# Altium schematic sheet [03] - ADSP.SchDoc
size A2; DocumentNumber: 2; SheetNumber: 3; SheetTotal: 10
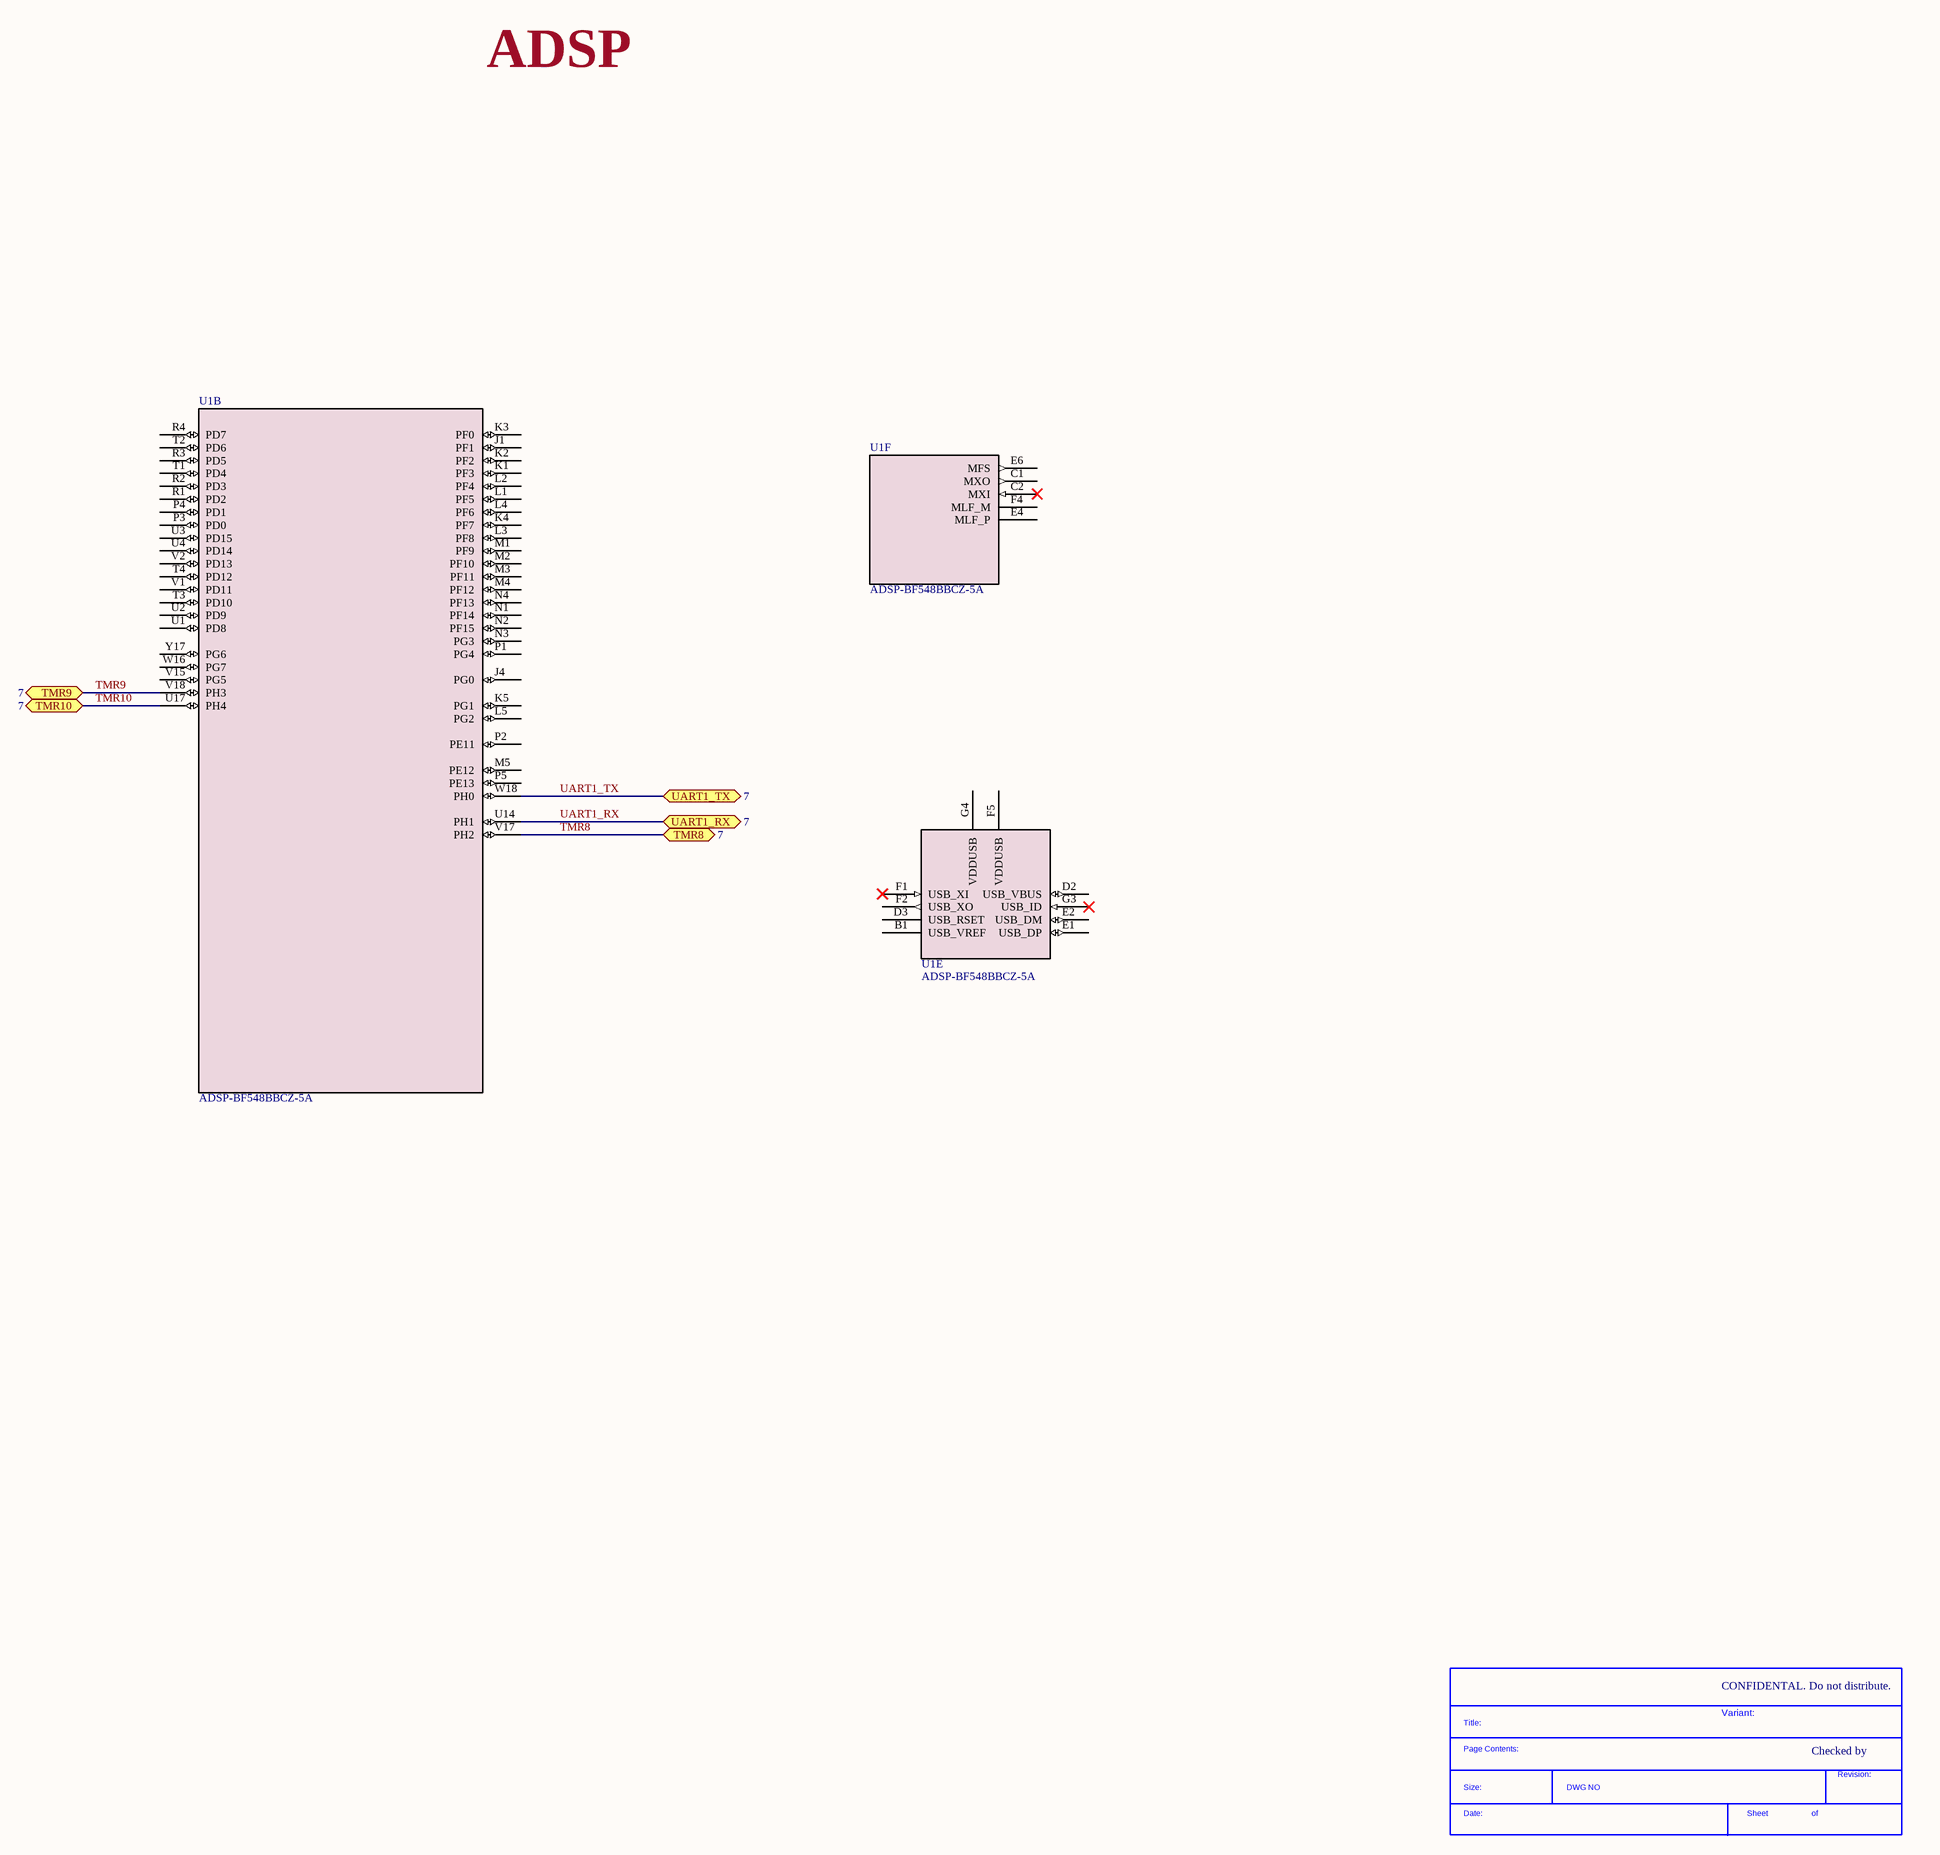
[diagram p0: [03] - ADSP.SchDoc]

## Parts
*  SDTitleBlock  (value not drawn)  (graphical)
U1  ADSP-BF548BBCZ-5A  [BC_400_1_ADI]  (parts B,E,F of 7)

## Ports
TMR8 (bidir, see 7), TMR9 (bidir, see 7), TMR10 (bidir, see 7), UART1_RX (bidir, see 7), UART1_TX (bidir, see 7)

## Nets
TMR8: U1.V17(PH2) ; port TMR8
TMR9: U1.V18(PH3) ; port TMR9
TMR10: U1.U17(PH4) ; port TMR10
UART1_RX: U1.U14(PH1) ; port UART1_RX
UART1_TX: U1.W18(PH0) ; port UART1_TX

Not connected (* = marked no-connect by the designer): U1 B1(USB_VREF) C1(MXO) C2(MXI)* D2(USB_VBUS) D3(USB_RSET) E1(USB_DP) E2(USB_DM) E4(MLF_P) E6(MFS) F1(USB_XI)* F2(USB_XO) F4(MLF_M) F5(VDDUSB) G3(USB_ID)* G4(VDDUSB) J1(PF1) J4(PG0) K1(PF3) K2(PF2) K3(PF0) K4(PF7) K5(PG1) L1(PF5) L2(PF4) L3(PF8) L4(PF6) L5(PG2) M1(PF9) M2(PF10) M3(PF11) M4(PF12) M5(PE12) N1(PF14) N2(PF15) N3(PG3) N4(PF13) P1(PG4) P2(PE11) P3(PD0) P4(PD1) P5(PE13) R1(PD2) R2(PD3) R3(PD5) R4(PD7) T1(PD4) T2(PD6) T3(PD10) T4(PD12) U1(PD8) U2(PD9) U3(PD15) U4(PD14) V1(PD11) V2(PD13) V15(PG5) W16(PG7) Y17(PG6)

## Notes on the sheet
- ADSP
- CONFIDENTAL. Do not distribute.
- Variant:
- Checked by
- (in symbol SDTitleBlock) Title:; Page Contents:; Revision:; Size:; DWG NO; Date:; Sheet; of

## Library data of the parts
U1 = ADSP-BF548BBCZ-5A: IC DSP 16BIT 533MHZ 400CSBGA; Manufacturer: Analog Devices Inc.; Manufacturer_Part_Number: ADSP-BF548BBCZ-5A; Supplier: Analog Devices Inc.; Manufacturer Product Number: ADSP-BF548BBCZ-5A; TypeDigi-Key Part Number: ADSP-BF548BBCZ-5A-ND